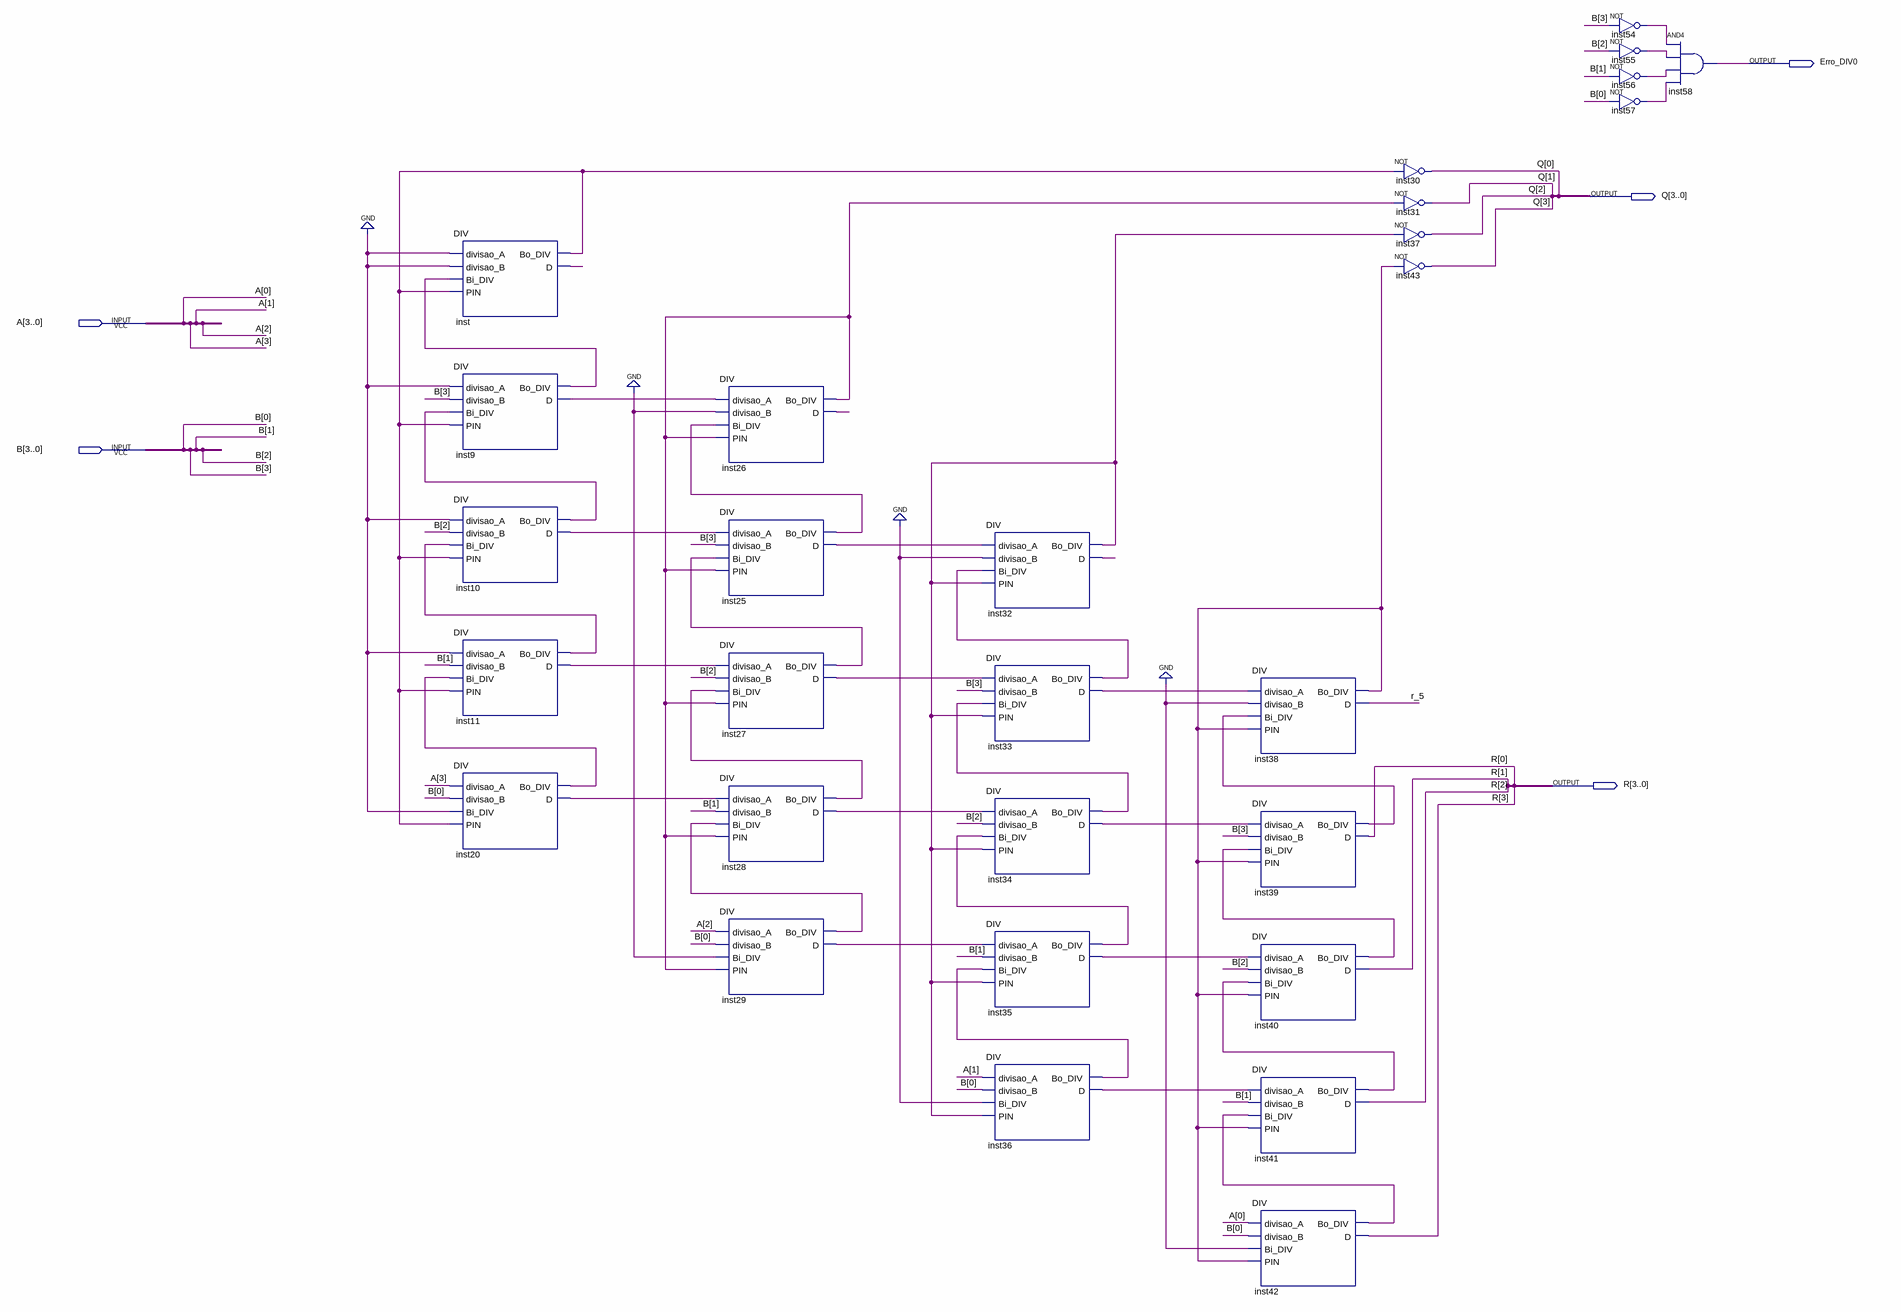
[diagram p0: schematic sheet]
// Quartus schematic aula_11.bdf as structural Verilog: 29 symbols, 5 pins
module aula_11 (
  input  [3:0] A,
  input  [3:0] B,
  output Erro_DIV0,
  output [3:0] Q,
  output [3:0] R
);

  wire inst9_bo_div, inst9_d, inst10_bo_div, inst10_d, inst11_bo_div, inst11_d, inst20_bo_div, inst20_d,
       inst25_bo_div, inst25_d, inst26_bo_div, inst26_d, inst27_bo_div, inst27_d, inst28_bo_div, inst28_d,
       inst29_bo_div, inst29_d, inst32_bo_div, inst32_d, inst33_bo_div, inst33_d, inst34_bo_div, inst34_d,
       inst35_bo_div, inst35_d, inst36_bo_div, inst36_d, inst38_bo_div, inst39_bo_div, inst40_bo_div,
       inst41_bo_div, inst42_bo_div, inst54_out, inst55_out, inst56_out, inst57_out, inst_bo_div, inst_d, r_5;

  DIV inst (
    .divisao_A(1'b0), .divisao_B(1'b0), .Bi_DIV(inst9_bo_div), .PIN(inst_bo_div), .Bo_DIV(inst_bo_div),
    .D(inst_d));
  DIV inst9 (
    .divisao_A(1'b0), .divisao_B(B[3]), .Bi_DIV(inst10_bo_div), .PIN(inst_bo_div), .Bo_DIV(inst9_bo_div),
    .D(inst9_d));
  DIV inst10 (
    .divisao_A(1'b0), .divisao_B(B[2]), .Bi_DIV(inst11_bo_div), .PIN(inst_bo_div), .Bo_DIV(inst10_bo_div),
    .D(inst10_d));
  DIV inst11 (
    .divisao_A(1'b0), .divisao_B(B[1]), .Bi_DIV(inst20_bo_div), .PIN(inst_bo_div), .Bo_DIV(inst11_bo_div),
    .D(inst11_d));
  DIV inst20 (
    .divisao_A(A[3]), .divisao_B(B[0]), .Bi_DIV(1'b0), .PIN(inst_bo_div), .Bo_DIV(inst20_bo_div), .D(inst20_d));
  DIV inst26 (
    .divisao_A(inst9_d), .divisao_B(1'b0), .Bi_DIV(inst25_bo_div), .PIN(inst26_bo_div),
    .Bo_DIV(inst26_bo_div), .D(inst26_d));
  DIV inst25 (
    .divisao_A(inst10_d), .divisao_B(B[3]), .Bi_DIV(inst27_bo_div), .PIN(inst26_bo_div),
    .Bo_DIV(inst25_bo_div), .D(inst25_d));
  DIV inst27 (
    .divisao_A(inst11_d), .divisao_B(B[2]), .Bi_DIV(inst28_bo_div), .PIN(inst26_bo_div),
    .Bo_DIV(inst27_bo_div), .D(inst27_d));
  DIV inst28 (
    .divisao_A(inst20_d), .divisao_B(B[1]), .Bi_DIV(inst29_bo_div), .PIN(inst26_bo_div),
    .Bo_DIV(inst28_bo_div), .D(inst28_d));
  DIV inst29 (
    .divisao_A(A[2]), .divisao_B(B[0]), .Bi_DIV(1'b0), .PIN(inst26_bo_div), .Bo_DIV(inst29_bo_div),
    .D(inst29_d));
  DIV inst32 (
    .divisao_A(inst25_d), .divisao_B(1'b0), .Bi_DIV(inst33_bo_div), .PIN(inst32_bo_div),
    .Bo_DIV(inst32_bo_div), .D(inst32_d));
  DIV inst33 (
    .divisao_A(inst27_d), .divisao_B(B[3]), .Bi_DIV(inst34_bo_div), .PIN(inst32_bo_div),
    .Bo_DIV(inst33_bo_div), .D(inst33_d));
  DIV inst34 (
    .divisao_A(inst28_d), .divisao_B(B[2]), .Bi_DIV(inst35_bo_div), .PIN(inst32_bo_div),
    .Bo_DIV(inst34_bo_div), .D(inst34_d));
  DIV inst35 (
    .divisao_A(inst29_d), .divisao_B(B[1]), .Bi_DIV(inst36_bo_div), .PIN(inst32_bo_div),
    .Bo_DIV(inst35_bo_div), .D(inst35_d));
  DIV inst36 (
    .divisao_A(A[1]), .divisao_B(B[0]), .Bi_DIV(1'b0), .PIN(inst32_bo_div), .Bo_DIV(inst36_bo_div),
    .D(inst36_d));
  DIV inst38 (
    .divisao_A(inst33_d), .divisao_B(1'b0), .Bi_DIV(inst39_bo_div), .PIN(inst38_bo_div),
    .Bo_DIV(inst38_bo_div), .D(r_5));
  DIV inst39 (
    .divisao_A(inst34_d), .divisao_B(B[3]), .Bi_DIV(inst40_bo_div), .PIN(inst38_bo_div),
    .Bo_DIV(inst39_bo_div), .D(R[0]));
  DIV inst40 (
    .divisao_A(inst35_d), .divisao_B(B[2]), .Bi_DIV(inst41_bo_div), .PIN(inst38_bo_div),
    .Bo_DIV(inst40_bo_div), .D(R[1]));
  DIV inst41 (
    .divisao_A(inst36_d), .divisao_B(B[1]), .Bi_DIV(inst42_bo_div), .PIN(inst38_bo_div),
    .Bo_DIV(inst41_bo_div), .D(R[2]));
  DIV inst42 (.divisao_A(A[0]), .divisao_B(B[0]), .Bi_DIV(1'b0), .PIN(inst38_bo_div), .Bo_DIV(inst42_bo_div), .D(R[3]));
  not inst30 (Q[0], inst_bo_div);
  not inst31 (Q[1], inst26_bo_div);
  not inst37 (Q[2], inst32_bo_div);
  not inst43 (Q[3], inst38_bo_div);
  not inst54 (inst54_out, B[3]);
  not inst55 (inst55_out, B[2]);
  not inst56 (inst56_out, B[1]);
  not inst57 (inst57_out, B[0]);
  and inst58 (Erro_DIV0, inst54_out, inst55_out, inst56_out, inst57_out);
endmodule
